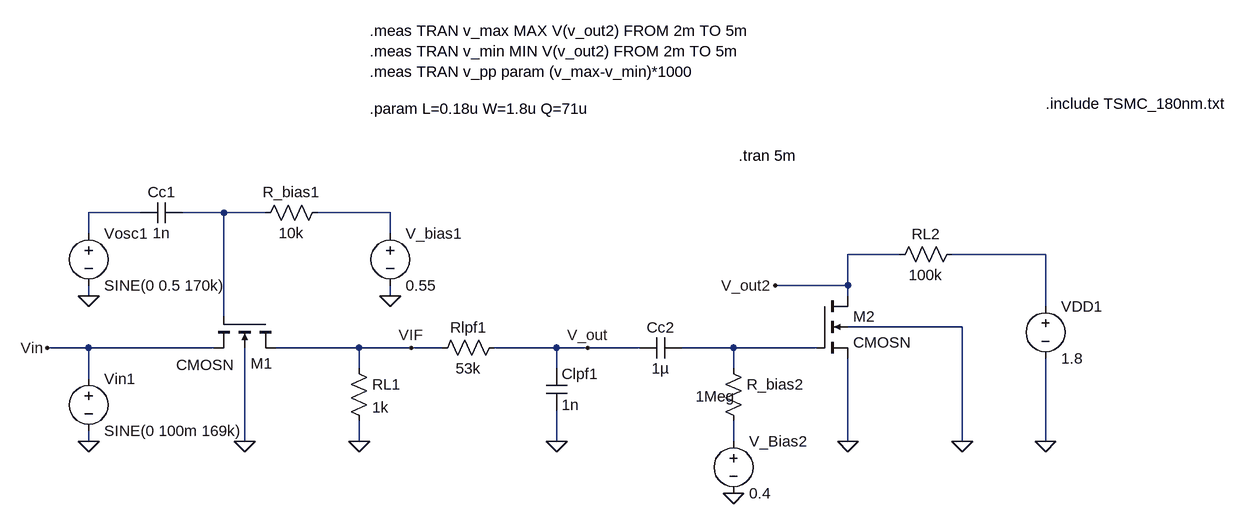
[diagram p0: schematic Amplifier1.asc]
Amplifier1.asc, the LTspice schematic file:
Version 4.1
SHEET 1 2444 680
WIRE -480 48 -560 48
WIRE -352 48 -416 48
WIRE -288 48 -352 48
WIRE -96 48 -208 48
WIRE -560 80 -560 48
WIRE -96 80 -96 48
WIRE 688 112 608 112
WIRE 912 112 768 112
WIRE 608 160 608 112
WIRE 608 160 496 160
WIRE -560 176 -560 160
WIRE -96 176 -96 160
WIRE 608 176 608 160
WIRE 912 192 912 112
WIRE -352 208 -352 48
WIRE 784 224 608 224
WIRE -560 256 -624 256
WIRE -368 256 -560 256
WIRE -144 256 -272 256
WIRE -64 256 -144 256
WIRE -16 256 -64 256
WIRE 160 256 64 256
WIRE 208 256 160 256
WIRE 288 256 208 256
WIRE 432 256 352 256
WIRE 560 256 432 256
WIRE -144 288 -144 256
WIRE 160 288 160 256
WIRE 432 288 432 256
WIRE -560 304 -560 256
WIRE -560 400 -560 384
WIRE -320 400 -320 256
WIRE -144 400 -144 368
WIRE 160 400 160 352
WIRE 432 400 432 368
WIRE 608 400 608 272
WIRE 784 400 784 224
WIRE 912 400 912 272
FLAG -560 400 0
FLAG -320 400 0
FLAG -144 400 0
FLAG -96 176 0
FLAG -560 176 0
FLAG -64 256 VIF
FLAG -624 256 Vin
FLAG 160 400 0
FLAG 208 256 V_out
FLAG 784 400 0
FLAG 608 400 0
FLAG 912 400 0
FLAG 496 160 V_out2
FLAG 432 480 0
SYMBOL nmos4 -272 208 R90
WINDOW 0 72 5 VRight 2
WINDOW 3 74 64 VRight 2
SYMATTR InstName M1
SYMATTR Value CMOSN
SYMATTR Value2 l=L w=W ad=5*L*W/2 as=5*L*W/2 pd=5*L+2*W ps=5*L+2*W
SYMBOL res -160 272 R0
SYMATTR InstName RL1
SYMATTR Value 1k
SYMBOL voltage -560 288 R0
WINDOW 123 0 0 Left 0
WINDOW 39 0 0 Left 0
SYMATTR InstName Vin1
SYMATTR Value SINE(0 100m 169k)
SYMBOL res -192 32 R90
WINDOW 0 0 56 VBottom 2
WINDOW 3 32 56 VTop 2
SYMATTR InstName R_bias1
SYMATTR Value 10k
SYMBOL voltage -96 64 R0
SYMATTR InstName V_bias1
SYMATTR Value 0.55
SYMBOL cap -416 32 R90
WINDOW 0 0 32 VBottom 2
WINDOW 3 32 32 VTop 2
SYMATTR InstName Cc1
SYMATTR Value 1n
SYMBOL voltage -560 64 R0
WINDOW 123 0 0 Left 0
WINDOW 39 0 0 Left 0
SYMATTR InstName Vosc1
SYMATTR Value SINE(0 0.5 170k)
SYMBOL res 80 240 R90
WINDOW 0 0 56 VBottom 2
WINDOW 3 32 56 VTop 2
SYMATTR InstName Rlpf1
SYMATTR Value 53k
SYMBOL cap 144 288 R0
SYMATTR InstName Clpf1
SYMATTR Value 1n
SYMBOL nmos4 560 176 R0
SYMATTR InstName M2
SYMATTR Value CMOSN
SYMATTR Value2 l=L w=Q ad=5*L*Q/2 as=5*L*Q/2 pd=5*L+2*Q ps=5*L+2*Q
SYMBOL res 784 96 R90
WINDOW 0 0 56 VBottom 2
WINDOW 3 32 56 VTop 2
SYMATTR InstName RL2
SYMATTR Value 100k
SYMBOL voltage 912 176 R0
WINDOW 123 0 0 Left 0
WINDOW 39 0 0 Left 0
SYMATTR InstName VDD1
SYMATTR Value 1.8
SYMBOL cap 352 240 R90
WINDOW 0 0 32 VBottom 2
WINDOW 3 32 32 VTop 2
SYMATTR InstName Cc2
SYMATTR Value 1µ
SYMBOL res 416 272 R0
WINDOW 3 -42 59 Left 2
SYMATTR Value 1Meg
SYMATTR InstName R_bias2
SYMBOL voltage 432 384 R0
SYMATTR InstName V_Bias2
SYMATTR Value 0.4
TEXT 912 -120 Left 2 !.include TSMC_180nm.txt
TEXT -128 -112 Left 2 !.param L=0.18u W=1.8u Q=71u
TEXT 440 -40 Left 2 !.tran 5m
TEXT -128 -232 Left 2 !.meas TRAN v_max MAX V(v_out2) FROM 2m TO 5m\n.meas TRAN v_min MIN V(v_out2) FROM 2m TO 5m\n.meas TRAN v_pp param (v_max-v_min)*1000

The netlist it stands for:
* Amplifier1.asc
M1 VIF N002 Vin 0 CMOSN l=L w=W ad=5*L*W/2 as=5*L*W/2 pd=5*L+2*W ps=5*L+2*W
RL1 VIF 0 1k
Vin1 Vin 0 SINE(0 100m 169k)
R_bias1 N003 N002 10k
V_bias1 N003 0 0.55
Cc1 N002 N001 1n
Vosc1 N001 0 SINE(0 0.5 170k)
Rlpf1 V_out VIF 53k
Clpf1 V_out 0 1n
M2 V_out2 N005 0 0 CMOSN l=L w=Q ad=5*L*Q/2 as=5*L*Q/2 pd=5*L+2*Q ps=5*L+2*Q
RL2 N004 V_out2 100k
VDD1 N004 0 1.8
Cc2 N005 V_out 1µ
R_bias2 N005 N006 1Meg
V_Bias2 N006 0 0.4
.model NMOS NMOS
.model PMOS PMOS
.lib standard.mos
.include TSMC_180nm.txt
.param L=0.18u W=1.8u Q=71u
.tran 5m
.meas TRAN v_max MAX V(v_out2) FROM 2m TO 5m
.meas TRAN v_min MIN V(v_out2) FROM 2m TO 5m
.meas TRAN v_pp param (v_max-v_min)*1000
.backanno
.end